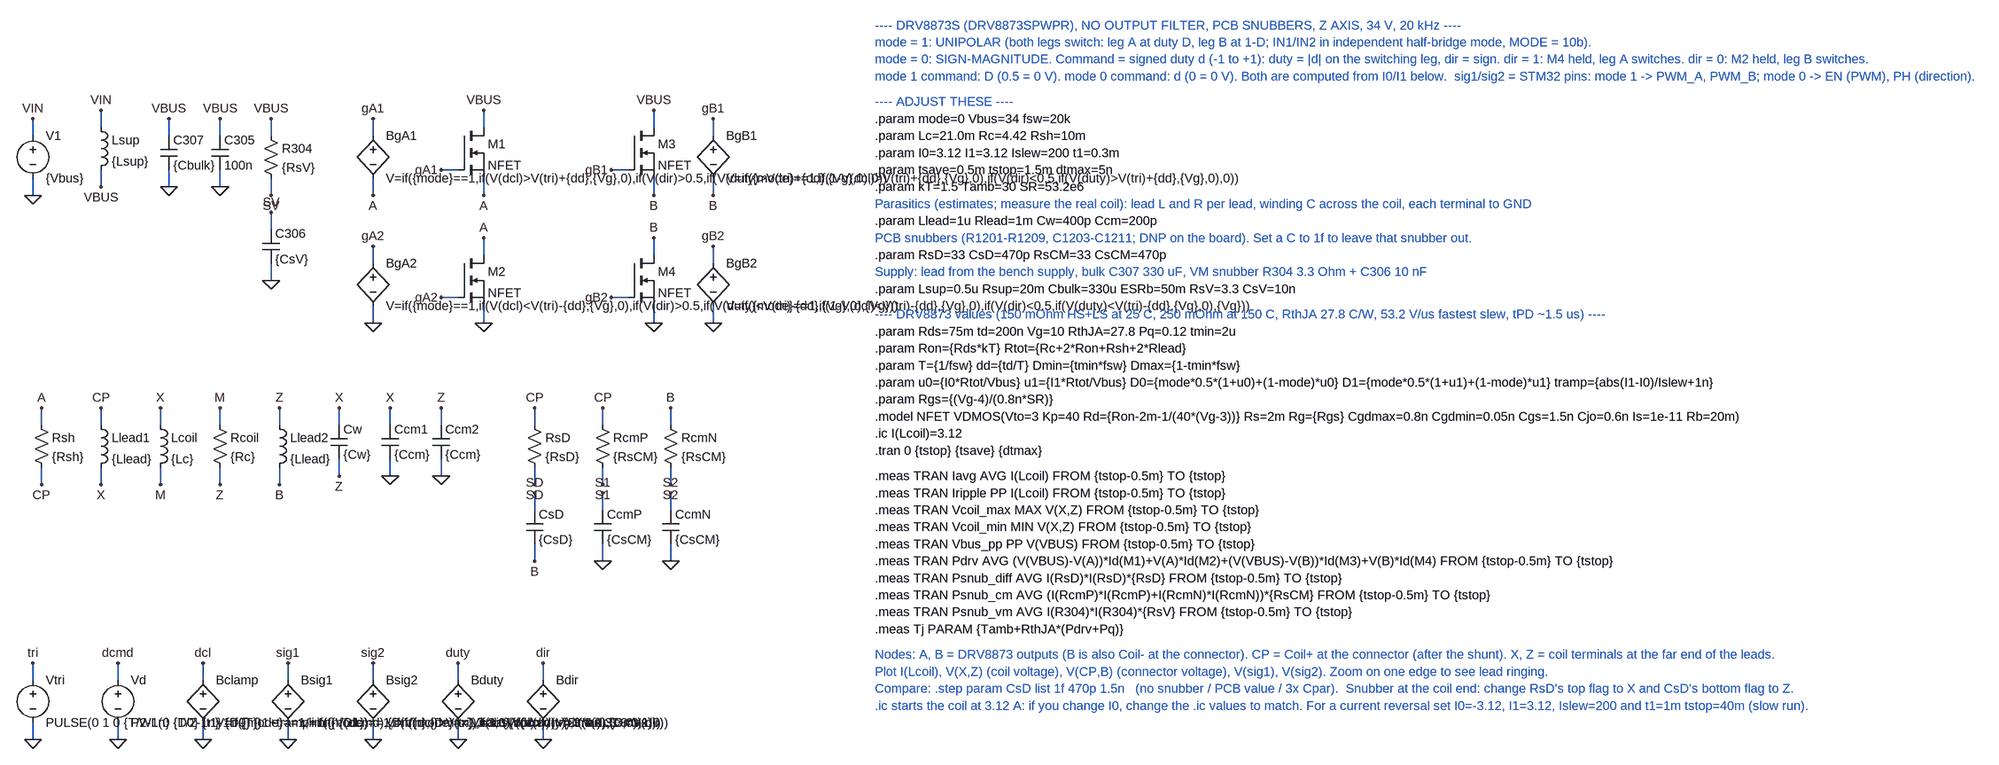
[diagram p0: schematic helmholtz_drv8873_100k_snubbers_34V_20kHz.asc]
helmholtz_drv8873_100k_snubbers_34V_20kHz.asc, the LTspice schematic file:
Version 4.1
SHEET 1 3600 1400
WIRE 448 96 448 64
WIRE 448 192 448 224
WIRE 400 176 368 176
WIRE 448 336 448 304
WIRE 448 432 448 464
WIRE 400 416 368 416
WIRE 768 96 768 64
WIRE 768 192 768 224
WIRE 720 176 688 176
WIRE 768 336 768 304
WIRE 768 432 768 464
WIRE 720 416 688 416
WIRE 240 112 240 80
WIRE 240 192 240 224
WIRE 240 352 240 320
WIRE 240 432 240 464
WIRE 880 112 880 80
WIRE 880 192 880 224
WIRE 880 352 880 320
WIRE 880 432 880 464
WIRE -400 112 -400 80
WIRE -400 192 -400 224
WIRE -272 96 -272 64
WIRE -272 176 -272 208
WIRE -144 112 -144 80
WIRE -144 176 -144 208
WIRE -48 112 -48 80
WIRE -48 176 -48 208
WIRE 48 112 48 80
WIRE 48 192 48 224
WIRE 48 288 48 256
WIRE 48 352 48 384
WIRE -384 656 -384 624
WIRE -384 736 -384 768
WIRE -272 656 -272 624
WIRE -272 736 -272 768
WIRE -160 656 -160 624
WIRE -160 736 -160 768
WIRE -48 656 -48 624
WIRE -48 736 -48 768
WIRE 64 656 64 624
WIRE 64 736 64 768
WIRE 176 656 176 624
WIRE 176 720 176 752
WIRE 272 656 272 624
WIRE 272 720 272 752
WIRE 368 656 368 624
WIRE 368 720 368 752
WIRE 544 656 544 624
WIRE 544 736 544 768
WIRE 544 816 544 784
WIRE 544 880 544 912
WIRE 672 656 672 624
WIRE 672 736 672 768
WIRE 672 816 672 784
WIRE 672 880 672 912
WIRE 800 656 800 624
WIRE 800 736 800 768
WIRE 800 816 800 784
WIRE 800 880 800 912
WIRE -400 1136 -400 1104
WIRE -400 1216 -400 1248
WIRE -240 1136 -240 1104
WIRE -240 1216 -240 1248
WIRE -80 1136 -80 1104
WIRE -80 1216 -80 1248
WIRE 400 1136 400 1104
WIRE 400 1216 400 1248
WIRE 560 1136 560 1104
WIRE 560 1216 560 1248
WIRE 80 1136 80 1104
WIRE 80 1216 80 1248
WIRE 240 1136 240 1104
WIRE 240 1216 240 1248
FLAG 448 64 VBUS
FLAG 448 224 A
FLAG 368 176 gA1
FLAG 448 304 A
FLAG 448 464 0
FLAG 368 416 gA2
FLAG 768 64 VBUS
FLAG 768 224 B
FLAG 688 176 gB1
FLAG 768 304 B
FLAG 768 464 0
FLAG 688 416 gB2
FLAG 240 80 gA1
FLAG 240 224 A
FLAG 240 320 gA2
FLAG 240 464 0
FLAG 880 80 gB1
FLAG 880 224 B
FLAG 880 320 gB2
FLAG 880 464 0
FLAG -400 80 VIN
FLAG -400 224 0
FLAG -272 64 VIN
FLAG -272 208 VBUS
FLAG -144 80 VBUS
FLAG -144 208 0
FLAG -48 80 VBUS
FLAG -48 208 0
FLAG 48 80 VBUS
FLAG 48 224 SV
FLAG 48 256 SV
FLAG 48 384 0
FLAG -384 624 A
FLAG -384 768 CP
FLAG -272 624 CP
FLAG -272 768 X
FLAG -160 624 X
FLAG -160 768 M
FLAG -48 624 M
FLAG -48 768 Z
FLAG 64 624 Z
FLAG 64 768 B
FLAG 176 624 X
FLAG 176 752 Z
FLAG 272 624 X
FLAG 272 752 0
FLAG 368 624 Z
FLAG 368 752 0
FLAG 544 624 CP
FLAG 544 768 SD
FLAG 544 784 SD
FLAG 544 912 B
FLAG 672 624 CP
FLAG 672 768 S1
FLAG 672 784 S1
FLAG 672 912 0
FLAG 800 624 B
FLAG 800 768 S2
FLAG 800 784 S2
FLAG 800 912 0
FLAG -400 1104 tri
FLAG -400 1248 0
FLAG -240 1104 dcmd
FLAG -240 1248 0
FLAG -80 1104 dcl
FLAG -80 1248 0
FLAG 400 1104 duty
FLAG 400 1248 0
FLAG 560 1104 dir
FLAG 560 1248 0
FLAG 80 1104 sig1
FLAG 80 1248 0
FLAG 240 1104 sig2
FLAG 240 1248 0
SYMBOL nmos 400 96 R0
SYMATTR InstName M1
SYMATTR Value NFET
SYMBOL nmos 400 336 R0
SYMATTR InstName M2
SYMATTR Value NFET
SYMBOL nmos 720 96 R0
SYMATTR InstName M3
SYMATTR Value NFET
SYMBOL nmos 720 336 R0
SYMATTR InstName M4
SYMATTR Value NFET
SYMBOL bv 240 96 R0
SYMATTR InstName BgA1
SYMATTR Value V=if({mode}==1,if(V(dcl)>V(tri)+{dd},{Vg},0),if(V(dir)>0.5,if(V(duty)>V(tri)+{dd},{Vg},0),0))
SYMBOL bv 240 336 R0
SYMATTR InstName BgA2
SYMATTR Value V=if({mode}==1,if(V(dcl)<V(tri)-{dd},{Vg},0),if(V(dir)>0.5,if(V(duty)<V(tri)-{dd},{Vg},0),{Vg}))
SYMBOL bv 880 96 R0
SYMATTR InstName BgB1
SYMATTR Value V=if({mode}==1,if(1-V(dcl)>V(tri)+{dd},{Vg},0),if(V(dir)<0.5,if(V(duty)>V(tri)+{dd},{Vg},0),0))
SYMBOL bv 880 336 R0
SYMATTR InstName BgB2
SYMATTR Value V=if({mode}==1,if(1-V(dcl)<V(tri)-{dd},{Vg},0),if(V(dir)<0.5,if(V(duty)<V(tri)-{dd},{Vg},0),{Vg}))
SYMBOL voltage -400 96 R0
SYMATTR InstName V1
SYMATTR Value {Vbus}
SYMBOL ind -288 80 R0
SYMATTR InstName Lsup
SYMATTR Value {Lsup}
SYMATTR SpiceLine Rser={Rsup}
SYMBOL cap -160 112 R0
SYMATTR InstName C307
SYMATTR Value {Cbulk}
SYMATTR SpiceLine Rser={ESRb}
SYMBOL cap -64 112 R0
SYMATTR InstName C305
SYMATTR Value 100n
SYMATTR SpiceLine Rser=5m
SYMBOL res 32 96 R0
SYMATTR InstName R304
SYMATTR Value {RsV}
SYMBOL cap 32 288 R0
SYMATTR InstName C306
SYMATTR Value {CsV}
SYMBOL res -400 640 R0
SYMATTR InstName Rsh
SYMATTR Value {Rsh}
SYMBOL ind -288 640 R0
SYMATTR InstName Llead1
SYMATTR Value {Llead}
SYMATTR SpiceLine Rser={Rlead}
SYMBOL ind -176 640 R0
SYMATTR InstName Lcoil
SYMATTR Value {Lc}
SYMBOL res -64 640 R0
SYMATTR InstName Rcoil
SYMATTR Value {Rc}
SYMBOL ind 48 640 R0
SYMATTR InstName Llead2
SYMATTR Value {Llead}
SYMATTR SpiceLine Rser={Rlead}
SYMBOL cap 160 656 R0
SYMATTR InstName Cw
SYMATTR Value {Cw}
SYMBOL cap 256 656 R0
SYMATTR InstName Ccm1
SYMATTR Value {Ccm}
SYMBOL cap 352 656 R0
SYMATTR InstName Ccm2
SYMATTR Value {Ccm}
SYMBOL res 528 640 R0
SYMATTR InstName RsD
SYMATTR Value {RsD}
SYMBOL cap 528 816 R0
SYMATTR InstName CsD
SYMATTR Value {CsD}
SYMBOL res 656 640 R0
SYMATTR InstName RcmP
SYMATTR Value {RsCM}
SYMBOL cap 656 816 R0
SYMATTR InstName CcmP
SYMATTR Value {CsCM}
SYMBOL res 784 640 R0
SYMATTR InstName RcmN
SYMATTR Value {RsCM}
SYMBOL cap 784 816 R0
SYMATTR InstName CcmN
SYMATTR Value {CsCM}
SYMBOL voltage -400 1120 R0
SYMATTR InstName Vtri
SYMATTR Value PULSE(0 1 0 {T/2-1n} {T/2-1n} 1n {T})
SYMBOL voltage -240 1120 R0
SYMATTR InstName Vd
SYMATTR Value PWL(0 {D0} {t1} {D0} {t1+tramp+1n} {D1})
SYMBOL bv -80 1120 R0
SYMATTR InstName Bclamp
SYMATTR Value V=if({mode}==1,limit(V(dcmd),{Dmin},{Dmax}),limit(V(dcmd),-{Dmax},{Dmax}))
SYMBOL bv 400 1120 R0
SYMATTR InstName Bduty
SYMATTR Value V=abs(V(dcl))
SYMBOL bv 560 1120 R0
SYMATTR InstName Bdir
SYMATTR Value V=if(V(dcl)>=0,1,0)
SYMBOL bv 80 1120 R0
SYMATTR InstName Bsig1
SYMATTR Value V=if({mode}==1,if(V(dcl)>V(tri),3.3,0),if(V(duty)>V(tri),3.3,0))
SYMBOL bv 240 1120 R0
SYMATTR InstName Bsig2
SYMATTR Value V=if({mode}==1,if(1-V(dcl)>V(tri),3.3,0),3.3*V(dir))
TEXT 1184 -96 Left 2 ;---- DRV8873S (DRV8873SPWPR), NO OUTPUT FILTER, PCB SNUBBERS, Z AXIS, 34 V, 20 kHz ----
TEXT 1184 -64 Left 2 ;mode = 1: UNIPOLAR (both legs switch: leg A at duty D, leg B at 1-D; IN1/IN2 in independent half-bridge mode, MODE = 10b).
TEXT 1184 -32 Left 2 ;mode = 0: SIGN-MAGNITUDE. Command = signed duty d (-1 to +1): duty = |d| on the switching leg, dir = sign. dir = 1: M4 held, leg A switches. dir = 0: M2 held, leg B switches.
TEXT 1184 0 Left 2 ;mode 1 command: D (0.5 = 0 V). mode 0 command: d (0 = 0 V). Both are computed from I0/I1 below.  sig1/sig2 = STM32 pins: mode 1 -> PWM_A, PWM_B; mode 0 -> EN (PWM), PH (direction).
TEXT 1184 48 Left 2 ;---- ADJUST THESE ----
TEXT 1184 80 Left 2 !.param mode=0 Vbus=34 fsw=20k
TEXT 1184 112 Left 2 !.param Lc=21.0m Rc=4.42 Rsh=10m
TEXT 1184 144 Left 2 !.param I0=3.12 I1=3.12 Islew=200 t1=0.3m
TEXT 1184 176 Left 2 !.param tsave=0.5m tstop=1.5m dtmax=5n
TEXT 1184 208 Left 2 !.param kT=1.5 Tamb=30 SR=53.2e6
TEXT 1184 240 Left 2 ;Parasitics (estimates; measure the real coil): lead L and R per lead, winding C across the coil, each terminal to GND
TEXT 1184 272 Left 2 !.param Llead=1u Rlead=1m Cw=400p Ccm=200p
TEXT 1184 304 Left 2 ;PCB snubbers (R1201-R1209, C1203-C1211; DNP on the board). Set a C to 1f to leave that snubber out.
TEXT 1184 336 Left 2 !.param RsD=33 CsD=470p RsCM=33 CsCM=470p
TEXT 1184 368 Left 2 ;Supply: lead from the bench supply, bulk C307 330 uF, VM snubber R304 3.3 Ohm + C306 10 nF
TEXT 1184 400 Left 2 !.param Lsup=0.5u Rsup=20m Cbulk=330u ESRb=50m RsV=3.3 CsV=10n
TEXT 1184 448 Left 2 ;---- DRV8873 values (150 mOhm HS+LS at 25 C, 250 mOhm at 150 C, RthJA 27.8 C/W, 53.2 V/us fastest slew, tPD ~1.5 us) ----
TEXT 1184 480 Left 2 !.param Rds=75m td=200n Vg=10 RthJA=27.8 Pq=0.12 tmin=2u
TEXT 1184 512 Left 2 !.param Ron={Rds*kT} Rtot={Rc+2*Ron+Rsh+2*Rlead}
TEXT 1184 544 Left 2 !.param T={1/fsw} dd={td/T} Dmin={tmin*fsw} Dmax={1-tmin*fsw}
TEXT 1184 576 Left 2 !.param u0={I0*Rtot/Vbus} u1={I1*Rtot/Vbus} D0={mode*0.5*(1+u0)+(1-mode)*u0} D1={mode*0.5*(1+u1)+(1-mode)*u1} tramp={abs(I1-I0)/Islew+1n}
TEXT 1184 608 Left 2 !.param Rgs={(Vg-4)/(0.8n*SR)}
TEXT 1184 640 Left 2 !.model NFET VDMOS(Vto=3 Kp=40 Rd={Ron-2m-1/(40*(Vg-3))} Rs=2m Rg={Rgs} Cgdmax=0.8n Cgdmin=0.05n Cgs=1.5n Cjo=0.6n Is=1e-11 Rb=20m)
TEXT 1184 672 Left 2 !.ic I(Lcoil)=3.12
TEXT 1184 704 Left 2 !.tran 0 {tstop} {tsave} {dtmax}
TEXT 1184 752 Left 2 !.meas TRAN Iavg AVG I(Lcoil) FROM {tstop-0.5m} TO {tstop}
TEXT 1184 784 Left 2 !.meas TRAN Iripple PP I(Lcoil) FROM {tstop-0.5m} TO {tstop}
TEXT 1184 816 Left 2 !.meas TRAN Vcoil_max MAX V(X,Z) FROM {tstop-0.5m} TO {tstop}
TEXT 1184 848 Left 2 !.meas TRAN Vcoil_min MIN V(X,Z) FROM {tstop-0.5m} TO {tstop}
TEXT 1184 880 Left 2 !.meas TRAN Vbus_pp PP V(VBUS) FROM {tstop-0.5m} TO {tstop}
TEXT 1184 912 Left 2 !.meas TRAN Pdrv AVG (V(VBUS)-V(A))*Id(M1)+V(A)*Id(M2)+(V(VBUS)-V(B))*Id(M3)+V(B)*Id(M4) FROM {tstop-0.5m} TO {tstop}
TEXT 1184 944 Left 2 !.meas TRAN Psnub_diff AVG I(RsD)*I(RsD)*{RsD} FROM {tstop-0.5m} TO {tstop}
TEXT 1184 976 Left 2 !.meas TRAN Psnub_cm AVG (I(RcmP)*I(RcmP)+I(RcmN)*I(RcmN))*{RsCM} FROM {tstop-0.5m} TO {tstop}
TEXT 1184 1008 Left 2 !.meas TRAN Psnub_vm AVG I(R304)*I(R304)*{RsV} FROM {tstop-0.5m} TO {tstop}
TEXT 1184 1040 Left 2 !.meas Tj PARAM {Tamb+RthJA*(Pdrv+Pq)}
TEXT 1184 1088 Left 2 ;Nodes: A, B = DRV8873 outputs (B is also Coil- at the connector). CP = Coil+ at the connector (after the shunt). X, Z = coil terminals at the far end of the leads.
TEXT 1184 1120 Left 2 ;Plot I(Lcoil), V(X,Z) (coil voltage), V(CP,B) (connector voltage), V(sig1), V(sig2). Zoom on one edge to see lead ringing.
TEXT 1184 1152 Left 2 ;Compare: .step param CsD list 1f 470p 1.5n   (no snubber / PCB value / 3x Cpar).  Snubber at the coil end: change RsD's top flag to X and CsD's bottom flag to Z.
TEXT 1184 1184 Left 2 ;.ic starts the coil at 3.12 A: if you change I0, change the .ic values to match. For a current reversal set I0=-3.12, I1=3.12, Islew=200 and t1=1m tstop=40m (slow run).

The netlist it stands for:
* helmholtz_drv8873_100k_snubbers_34V_20kHz.asc
M1 VBUS gA1 A A NFET
M2 A gA2 0 0 NFET
M3 VBUS gB1 B B NFET
M4 B gB2 0 0 NFET
BgA1 gA1 A V=if({mode}==1,if(V(dcl)>V(tri)+{dd},{Vg},0),if(V(dir)>0.5,if(V(duty)>V(tri)+{dd},{Vg},0),0))
BgA2 gA2 0 V=if({mode}==1,if(V(dcl)<V(tri)-{dd},{Vg},0),if(V(dir)>0.5,if(V(duty)<V(tri)-{dd},{Vg},0),{Vg}))
BgB1 gB1 B V=if({mode}==1,if(1-V(dcl)>V(tri)+{dd},{Vg},0),if(V(dir)<0.5,if(V(duty)>V(tri)+{dd},{Vg},0),0))
BgB2 gB2 0 V=if({mode}==1,if(1-V(dcl)<V(tri)-{dd},{Vg},0),if(V(dir)<0.5,if(V(duty)<V(tri)-{dd},{Vg},0),{Vg}))
V1 VIN 0 {Vbus}
Lsup VIN VBUS {Lsup} Rser={Rsup}
C307 VBUS 0 {Cbulk} Rser={ESRb}
C305 VBUS 0 100n Rser=5m
R304 VBUS SV {RsV}
C306 SV 0 {CsV}
Rsh A CP {Rsh}
Llead1 CP X {Llead} Rser={Rlead}
Lcoil X M {Lc}
Rcoil M Z {Rc}
Llead2 Z B {Llead} Rser={Rlead}
Cw X Z {Cw}
Ccm1 X 0 {Ccm}
Ccm2 Z 0 {Ccm}
RsD CP SD {RsD}
CsD SD B {CsD}
RcmP CP S1 {RsCM}
CcmP S1 0 {CsCM}
RcmN B S2 {RsCM}
CcmN S2 0 {CsCM}
Vtri tri 0 PULSE(0 1 0 {T/2-1n} {T/2-1n} 1n {T})
Vd dcmd 0 PWL(0 {D0} {t1} {D0} {t1+tramp+1n} {D1})
Bclamp dcl 0 V=if({mode}==1,limit(V(dcmd),{Dmin},{Dmax}),limit(V(dcmd),-{Dmax},{Dmax}))
Bduty duty 0 V=abs(V(dcl))
Bdir dir 0 V=if(V(dcl)>=0,1,0)
Bsig1 sig1 0 V=if({mode}==1,if(V(dcl)>V(tri),3.3,0),if(V(duty)>V(tri),3.3,0))
Bsig2 sig2 0 V=if({mode}==1,if(1-V(dcl)>V(tri),3.3,0),3.3*V(dir))
.model NMOS NMOS
.model PMOS PMOS
.lib standard.mos
* ---- DRV8873S (DRV8873SPWPR), NO OUTPUT FILTER, PCB SNUBBERS, Z AXIS, 34 V, 20 kHz ----
* mode = 1: UNIPOLAR (both legs switch: leg A at duty D, leg B at 1-D; IN1/IN2 in independent half-bridge mode, MODE = 10b).
* mode = 0: SIGN-MAGNITUDE. Command = signed duty d (-1 to +1): duty = |d| on the switching leg, dir = sign. dir = 1: M4 held, leg A switches. dir = 0: M2 held, leg B switches.
* mode 1 command: D (0.5 = 0 V). mode 0 command: d (0 = 0 V). Both are computed from I0/I1 below.  sig1/sig2 = STM32 pins: mode 1 -> PWM_A, PWM_B; mode 0 -> EN (PWM), PH (direction).
* ---- ADJUST THESE ----
.param mode=0 Vbus=34 fsw=20k
.param Lc=21.0m Rc=4.42 Rsh=10m
.param I0=3.12 I1=3.12 Islew=200 t1=0.3m
.param tsave=0.5m tstop=1.5m dtmax=5n
.param kT=1.5 Tamb=30 SR=53.2e6
* Parasitics (estimates; measure the real coil): lead L and R per lead, winding C across the coil, each terminal to GND
.param Llead=1u Rlead=1m Cw=400p Ccm=200p
* PCB snubbers (R1201-R1209, C1203-C1211; DNP on the board). Set a C to 1f to leave that snubber out.
.param RsD=33 CsD=470p RsCM=33 CsCM=470p
* Supply: lead from the bench supply, bulk C307 330 uF, VM snubber R304 3.3 Ohm + C306 10 nF
.param Lsup=0.5u Rsup=20m Cbulk=330u ESRb=50m RsV=3.3 CsV=10n
* ---- DRV8873 values (150 mOhm HS+LS at 25 C, 250 mOhm at 150 C, RthJA 27.8 C/W, 53.2 V/us fastest slew, tPD ~1.5 us) ----
.param Rds=75m td=200n Vg=10 RthJA=27.8 Pq=0.12 tmin=2u
.param Ron={Rds*kT} Rtot={Rc+2*Ron+Rsh+2*Rlead}
.param T={1/fsw} dd={td/T} Dmin={tmin*fsw} Dmax={1-tmin*fsw}
.param u0={I0*Rtot/Vbus} u1={I1*Rtot/Vbus} D0={mode*0.5*(1+u0)+(1-mode)*u0} D1={mode*0.5*(1+u1)+(1-mode)*u1} tramp={abs(I1-I0)/Islew+1n}
.param Rgs={(Vg-4)/(0.8n*SR)}
.model NFET VDMOS(Vto=3 Kp=40 Rd={Ron-2m-1/(40*(Vg-3))} Rs=2m Rg={Rgs} Cgdmax=0.8n Cgdmin=0.05n Cgs=1.5n Cjo=0.6n Is=1e-11 Rb=20m)
.ic I(Lcoil)=3.12
.tran 0 {tstop} {tsave} {dtmax}
.meas TRAN Iavg AVG I(Lcoil) FROM {tstop-0.5m} TO {tstop}
.meas TRAN Iripple PP I(Lcoil) FROM {tstop-0.5m} TO {tstop}
.meas TRAN Vcoil_max MAX V(X,Z) FROM {tstop-0.5m} TO {tstop}
.meas TRAN Vcoil_min MIN V(X,Z) FROM {tstop-0.5m} TO {tstop}
.meas TRAN Vbus_pp PP V(VBUS) FROM {tstop-0.5m} TO {tstop}
.meas TRAN Pdrv AVG (V(VBUS)-V(A))*Id(M1)+V(A)*Id(M2)+(V(VBUS)-V(B))*Id(M3)+V(B)*Id(M4) FROM {tstop-0.5m} TO {tstop}
.meas TRAN Psnub_diff AVG I(RsD)*I(RsD)*{RsD} FROM {tstop-0.5m} TO {tstop}
.meas TRAN Psnub_cm AVG (I(RcmP)*I(RcmP)+I(RcmN)*I(RcmN))*{RsCM} FROM {tstop-0.5m} TO {tstop}
.meas TRAN Psnub_vm AVG I(R304)*I(R304)*{RsV} FROM {tstop-0.5m} TO {tstop}
.meas Tj PARAM {Tamb+RthJA*(Pdrv+Pq)}
* Nodes: A, B = DRV8873 outputs (B is also Coil- at the connector). CP = Coil+ at the connector (after the shunt). X, Z = coil terminals at the far end of the leads.
* Plot I(Lcoil), V(X,Z) (coil voltage), V(CP,B) (connector voltage), V(sig1), V(sig2). Zoom on one edge to see lead ringing.
* Compare: .step param CsD list 1f 470p 1.5n   (no snubber / PCB value / 3x Cpar).  Snubber at the coil end: change RsD's top flag to X and CsD's bottom flag to Z.
* .ic starts the coil at 3.12 A: if you change I0, change the .ic values to match. For a current reversal set I0=-3.12, I1=3.12, Islew=200 and t1=1m tstop=40m (slow run).
.backanno
.end